# Altium schematic sheet 09_20_MCU_CORE.SchDoc
size 289 x 404 mm
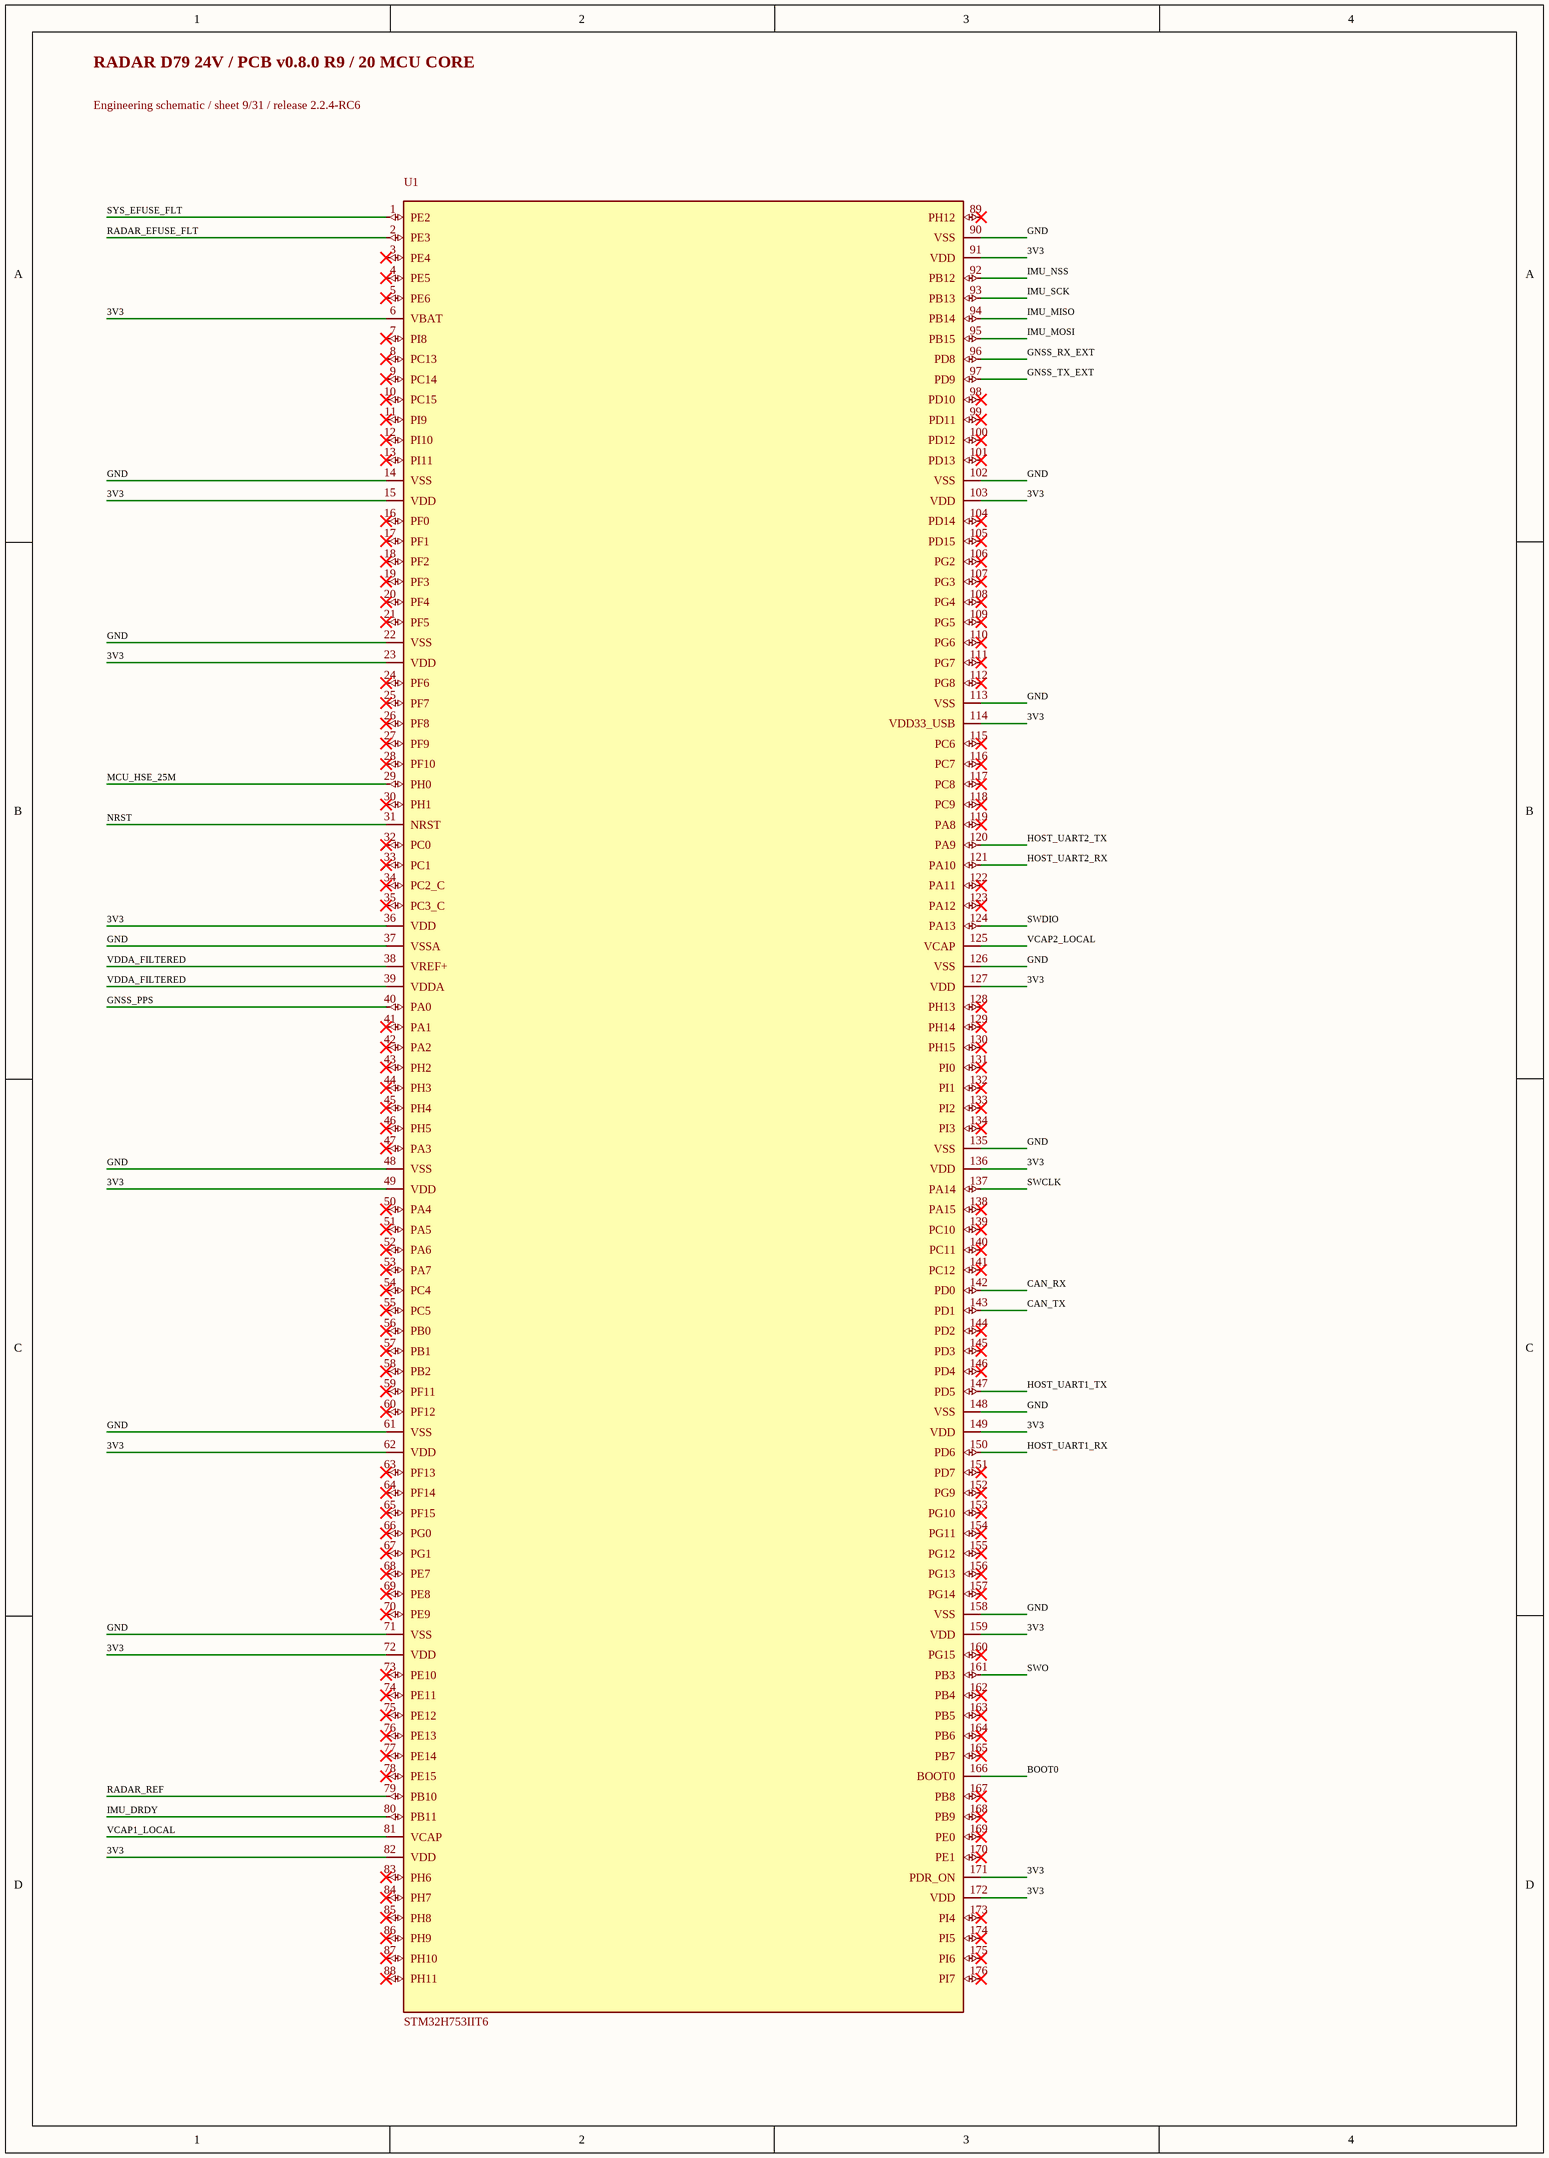
[diagram p0: 09_20_MCU_CORE.SchDoc]

## Parts
U1  STM32H753IIT6  [LQFP-176_24x24mm_P0.5mm]

## Nets
3V3: U1.6(VBAT) U1.15(VDD) U1.23(VDD) U1.36(VDD) U1.49(VDD) U1.62(VDD) U1.72(VDD) U1.82(VDD) U1.91(VDD) U1.103(VDD) U1.114(VDD33_USB) U1.127(VDD) U1.136(VDD) U1.149(VDD) U1.159(VDD) U1.171(PDR_ON) U1.172(VDD)
BOOT0: U1.166(BOOT0)
CAN_RX: U1.142(PD0)
CAN_TX: U1.143(PD1)
GND: U1.14(VSS) U1.22(VSS) U1.37(VSSA) U1.48(VSS) U1.61(VSS) U1.71(VSS) U1.90(VSS) U1.102(VSS) U1.113(VSS) U1.126(VSS) U1.135(VSS) U1.148(VSS) U1.158(VSS)
GNSS_PPS: U1.40(PA0)
GNSS_RX_EXT: U1.96(PD8)
GNSS_TX_EXT: U1.97(PD9)
HOST_UART1_RX: U1.150(PD6)
HOST_UART1_TX: U1.147(PD5)
HOST_UART2_RX: U1.121(PA10)
HOST_UART2_TX: U1.120(PA9)
IMU_DRDY: U1.80(PB11)
IMU_MISO: U1.94(PB14)
IMU_MOSI: U1.95(PB15)
IMU_NSS: U1.92(PB12)
IMU_SCK: U1.93(PB13)
MCU_HSE_25M: U1.29(PH0)
NRST: U1.31(NRST)
RADAR_EFUSE_FLT: U1.2(PE3)
RADAR_REF: U1.79(PB10)
SWCLK: U1.137(PA14)
SWDIO: U1.124(PA13)
SWO: U1.161(PB3)
SYS_EFUSE_FLT: U1.1(PE2)
VCAP1_LOCAL: U1.81(VCAP)
VCAP2_LOCAL: U1.125(VCAP)
VDDA_FILTERED: U1.38(VREF+) U1.39(VDDA)

Not connected (* = marked no-connect by the designer): U1 3(PE4)* 4(PE5)* 5(PE6)* 7(PI8)* 8(PC13)* 9(PC14)* 10(PC15)* 11(PI9)* 12(PI10)* 13(PI11)* 16(PF0)* 17(PF1)* 18(PF2)* 19(PF3)* 20(PF4)* 21(PF5)* 24(PF6)* 25(PF7)* 26(PF8)* 27(PF9)* 28(PF10)* 30(PH1)* 32(PC0)* 33(PC1)* 34(PC2_C)* 35(PC3_C)* 41(PA1)* 42(PA2)* 43(PH2)* 44(PH3)* 45(PH4)* 46(PH5)* 47(PA3)* 50(PA4)* 51(PA5)* 52(PA6)* 53(PA7)* 54(PC4)* 55(PC5)* 56(PB0)* 57(PB1)* 58(PB2)* 59(PF11)* 60(PF12)* 63(PF13)* 64(PF14)* 65(PF15)* 66(PG0)* 67(PG1)* 68(PE7)* 69(PE8)* 70(PE9)* 73(PE10)* 74(PE11)* 75(PE12)* 76(PE13)* 77(PE14)* 78(PE15)* 83(PH6)* 84(PH7)* 85(PH8)* 86(PH9)* 87(PH10)* 88(PH11)* 89(PH12)* 98(PD10)* 99(PD11)* 100(PD12)* 101(PD13)* 104(PD14)* 105(PD15)* 106(PG2)* 107(PG3)* 108(PG4)* 109(PG5)* 110(PG6)* 111(PG7)* 112(PG8)* 115(PC6)* 116(PC7)* 117(PC8)* 118(PC9)* 119(PA8)* 122(PA11)* 123(PA12)* 128(PH13)* 129(PH14)* 130(PH15)* 131(PI0)* 132(PI1)* 133(PI2)* 134(PI3)* 138(PA15)* 139(PC10)* 140(PC11)* 141(PC12)* 144(PD2)* 145(PD3)* 146(PD4)* 151(PD7)* 152(PG9)* 153(PG10)* 154(PG11)* 155(PG12)* 156(PG13)* 157(PG14)* 160(PG15)* 162(PB4)* 163(PB5)* 164(PB6)* 165(PB7)* 167(PB8)* 168(PB9)* 169(PE0)* 170(PE1)* 173(PI4)* 174(PI5)* 175(PI6)* 176(PI7)*

## Notes on the sheet
- RADAR D79 24V / PCB v0.8.0 R9 / 20 MCU CORE
- Engineering schematic / sheet 9/31 / release 2.2.4-RC6